# Altium schematic sheet Top.SchDoc
size A4; SheetNumber: 1; SheetTotal: 4
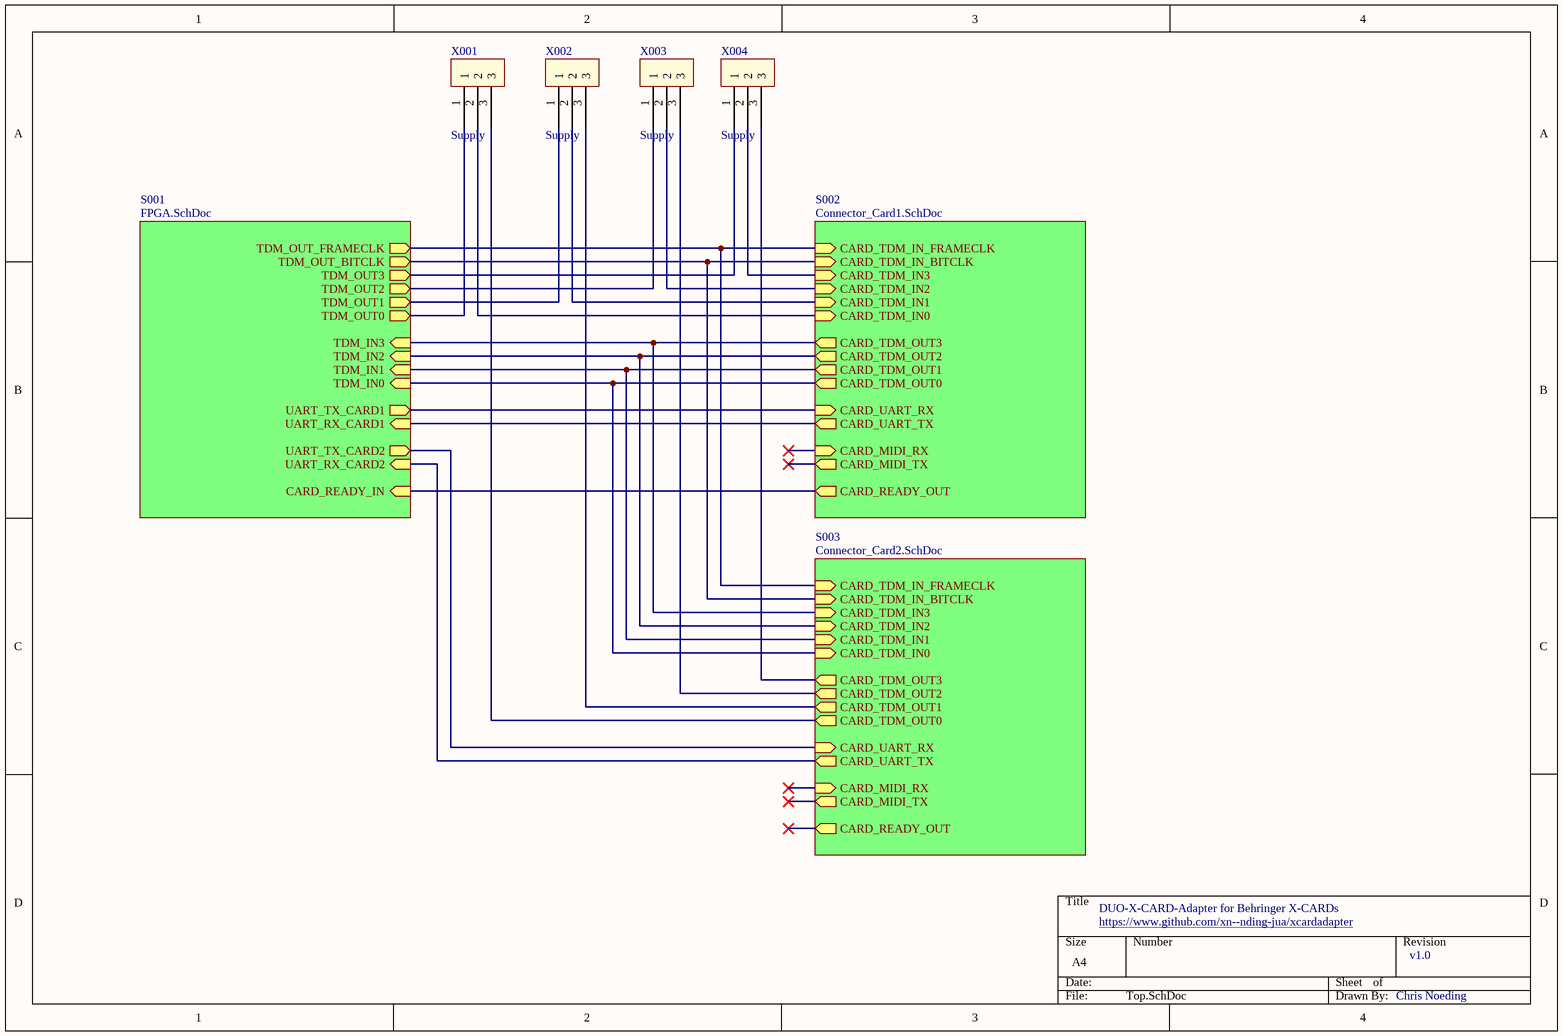
[diagram p0: Top.SchDoc]

## Parts
X001  Supply  [1x3 Jumper]
X002  Supply  [1x3 Jumper]
X003  Supply  [1x3 Jumper]
X004  Supply  [1x3 Jumper]

## Sub-sheets
S001 = FPGA.SchDoc: TDM_OUT_FRAMECLK (out), TDM_OUT_BITCLK (out), TDM_OUT3 (out), TDM_OUT2 (out), TDM_OUT1 (out), TDM_OUT0 (out), TDM_IN3 (in), TDM_IN2 (in), TDM_IN1 (in), TDM_IN0 (in), UART_TX_CARD1 (out), UART_RX_CARD1 (in), UART_TX_CARD2 (out), UART_RX_CARD2 (in), CARD_READY_IN (in)
S002 = Connector_Card1.SchDoc: CARD_TDM_IN_FRAMECLK (in), CARD_TDM_IN_BITCLK (in), CARD_TDM_IN3 (in), CARD_TDM_IN2 (in), CARD_TDM_IN1 (in), CARD_TDM_IN0 (in), CARD_TDM_OUT3 (out), CARD_TDM_OUT2 (out), CARD_TDM_OUT1 (out), CARD_TDM_OUT0 (out), CARD_UART_RX (in), CARD_UART_TX (out), CARD_MIDI_RX (in), CARD_MIDI_TX (out), CARD_READY_OUT (out)
S003 = Connector_Card2.SchDoc: CARD_TDM_IN_FRAMECLK (in), CARD_TDM_IN_BITCLK (in), CARD_TDM_IN3 (in), CARD_TDM_IN2 (in), CARD_TDM_IN1 (in), CARD_TDM_IN0 (in), CARD_TDM_OUT3 (out), CARD_TDM_OUT2 (out), CARD_TDM_OUT1 (out), CARD_TDM_OUT0 (out), CARD_UART_RX (in), CARD_UART_TX (out), CARD_MIDI_RX (in), CARD_MIDI_TX (out), CARD_READY_OUT (out)

## Nets
NetX001_1: X001.1 ; sheet S001/TDM_OUT0
NetX001_2: X001.2 ; sheet S002/CARD_TDM_IN0
NetX001_3: X001.3 ; sheet S003/CARD_TDM_OUT0
NetX002_1: X002.1 ; sheet S001/TDM_OUT1
NetX002_2: X002.2 ; sheet S002/CARD_TDM_IN1
NetX002_3: X002.3 ; sheet S003/CARD_TDM_OUT1
NetX003_1: X003.1 ; sheet S001/TDM_OUT2
NetX003_2: X003.2 ; sheet S002/CARD_TDM_IN2
NetX003_3: X003.3 ; sheet S003/CARD_TDM_OUT2
NetX004_1: X004.1 ; sheet S001/TDM_OUT3
NetX004_2: X004.2 ; sheet S002/CARD_TDM_IN3
NetX004_3: X004.3 ; sheet S003/CARD_TDM_OUT3
(unnamed): sheet S001/TDM_OUT_FRAMECLK, sheet S002/CARD_TDM_IN_FRAMECLK, sheet S003/CARD_TDM_IN_FRAMECLK
(unnamed): sheet S001/TDM_OUT_BITCLK, sheet S002/CARD_TDM_IN_BITCLK, sheet S003/CARD_TDM_IN_BITCLK
(unnamed): sheet S001/TDM_IN3, sheet S002/CARD_TDM_OUT3, sheet S003/CARD_TDM_IN3
(unnamed): sheet S001/TDM_IN2, sheet S002/CARD_TDM_OUT2, sheet S003/CARD_TDM_IN2
(unnamed): sheet S001/TDM_IN1, sheet S002/CARD_TDM_OUT1, sheet S003/CARD_TDM_IN1
(unnamed): sheet S001/TDM_IN0, sheet S002/CARD_TDM_OUT0, sheet S003/CARD_TDM_IN0
(unnamed): sheet S001/UART_TX_CARD1, sheet S002/CARD_UART_RX
(unnamed): sheet S001/UART_RX_CARD1, sheet S002/CARD_UART_TX
(unnamed): sheet S001/UART_TX_CARD2, sheet S003/CARD_UART_RX
(unnamed): sheet S001/UART_RX_CARD2, sheet S003/CARD_UART_TX
(unnamed): sheet S001/CARD_READY_IN, sheet S002/CARD_READY_OUT

## Notes on the sheet
- DUO-X-CARD-Adapter for Behringer X-CARDs
- https://www.github.com/xn--nding-jua/xcardadapter
- v1.0
- Chris Noeding

## Library data of the parts
X001 X002 X003 X004 = 1x3 Jumper